# Altium schematic sheet 09_test8.SchDoc
size A3
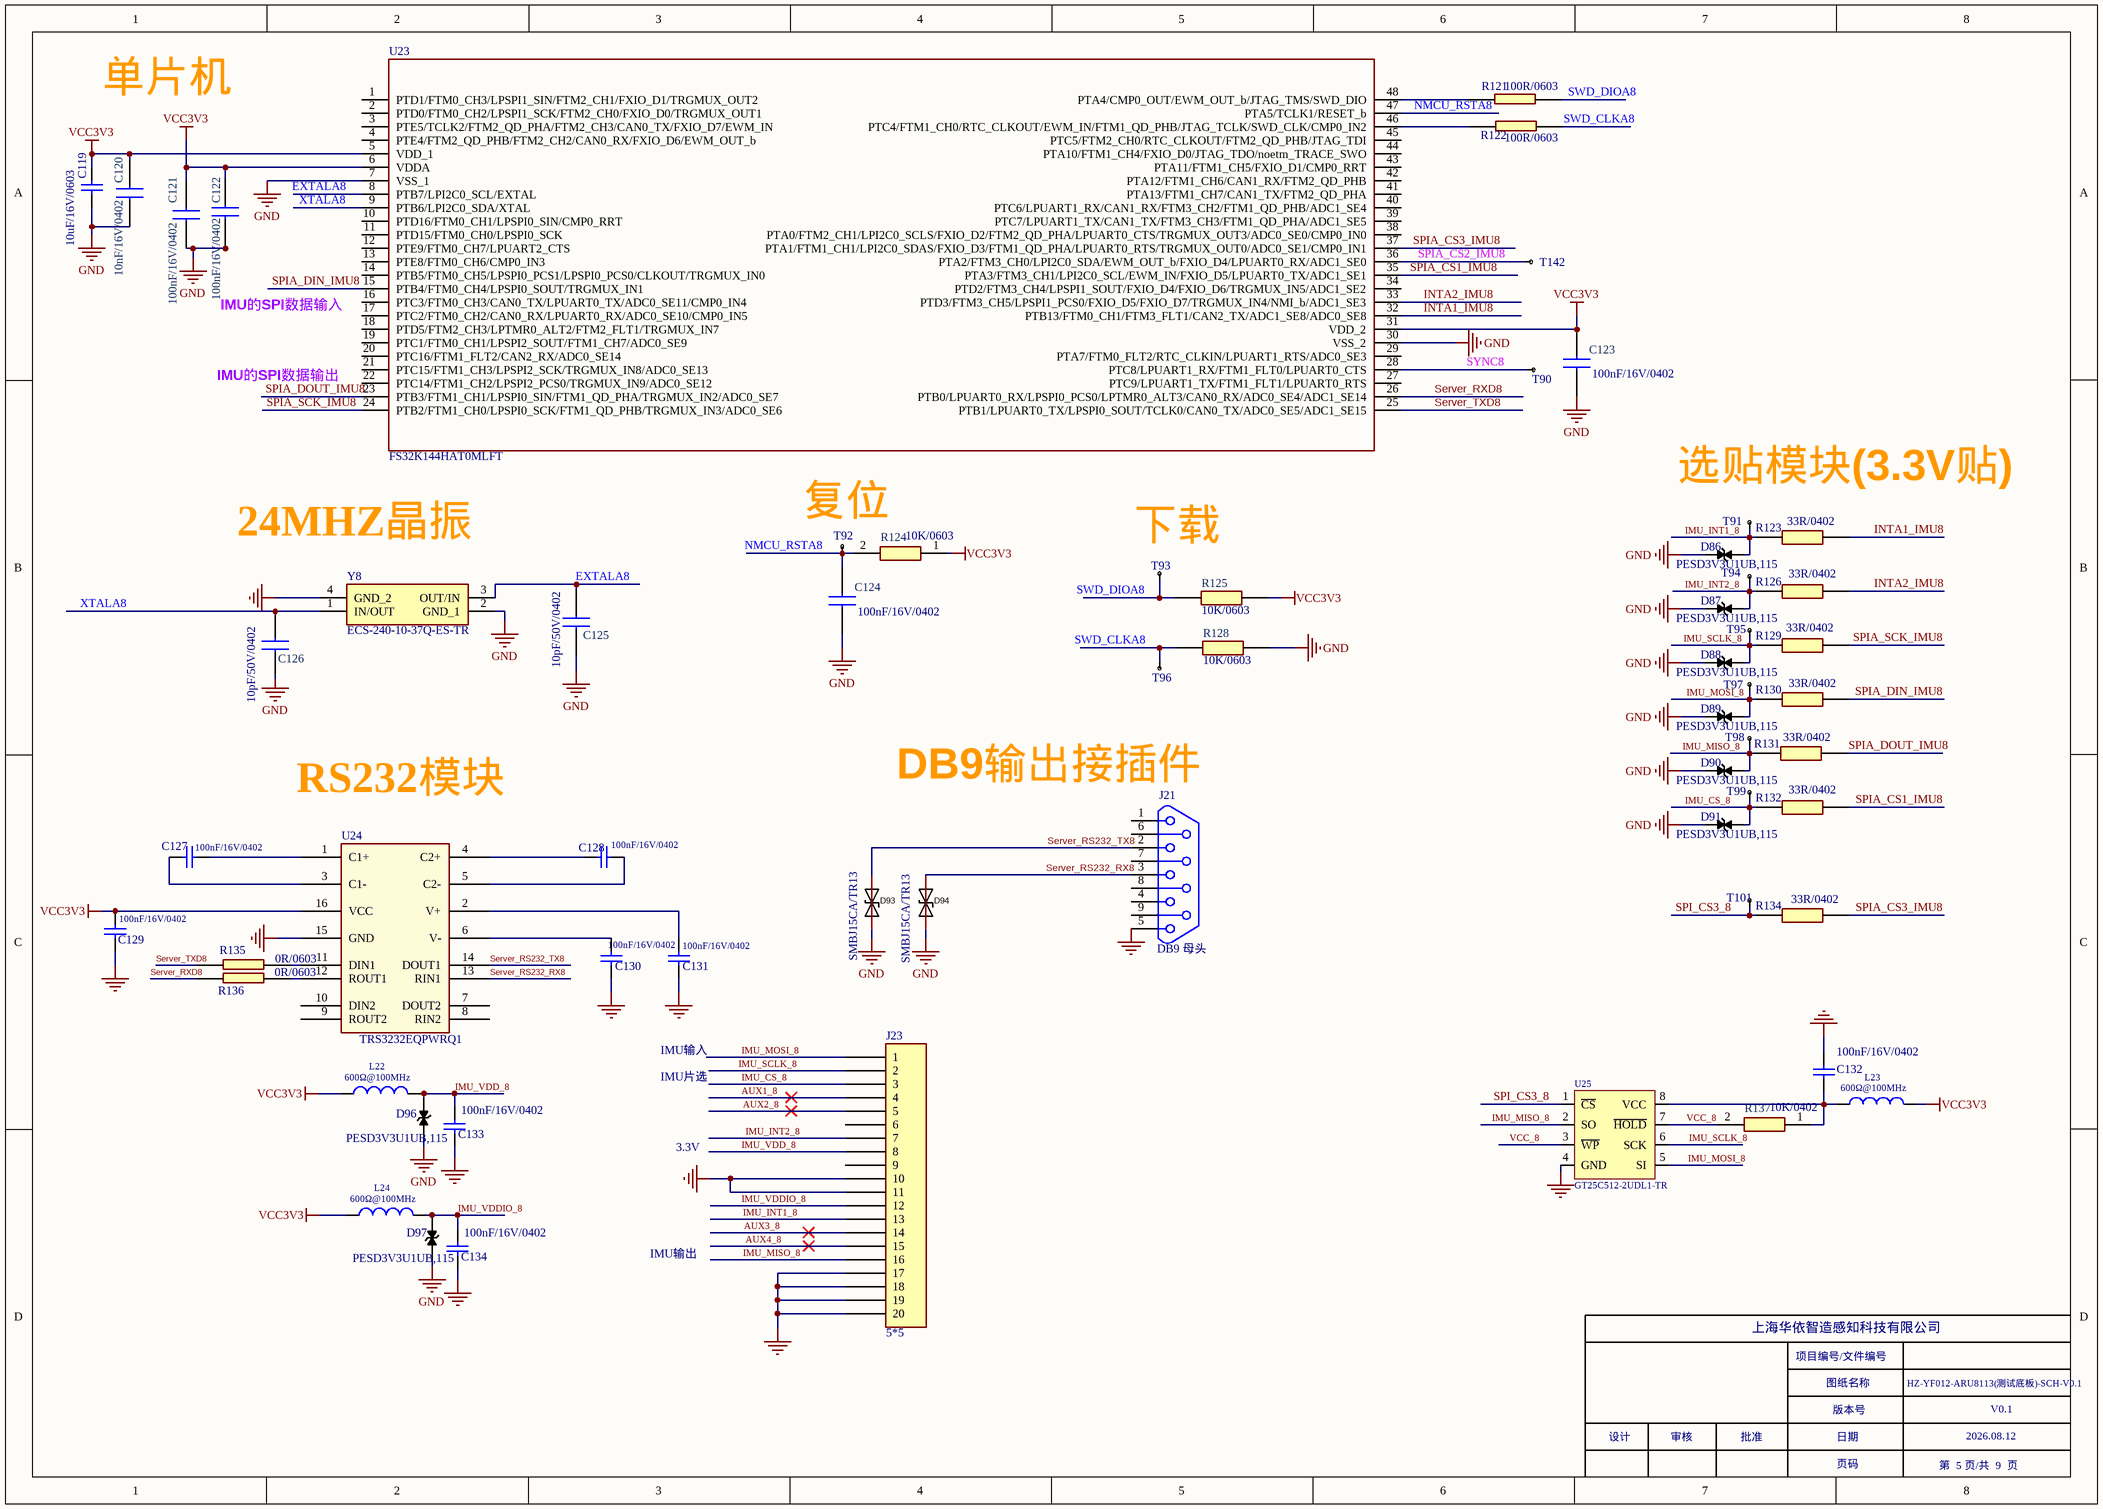
[diagram p0: 09_test8.SchDoc]

## Parts
C119  10uF/16V/0603  [C 0603_L]
C120  10nF/16V/0402  [C 0402_L]
C121  100nF/16V/0402  [C 0402_L]
C122  100nF/16V/0402  [C 0402_L]
C123  100nF/16V/0402  [C 0402_L]
C124  100nF/16V/0402  [C 0402_L]
C125  10pF/50V/0402  [C 0402_L]
C126  10pF/50V/0402  [C 0402_L]
C127  value 100nF/16V/0402  [C 0402_L]  (hidden comment: Cap)
C128  value 100nF/16V/0402  [C 0402_L]  (hidden comment: Cap)
C129  value 100nF/16V/0402  [C 0402_L]  (hidden comment: Cap)
C130  value 100nF/16V/0402  [C 0402_L]  (hidden comment: Cap)
C131  value 100nF/16V/0402  [C 0402_L]  (hidden comment: Cap)
C132  100nF/16V/0402  [0402C]
C133  100nF/16V/0402  [0402C]
C134  100nF/16V/0402  [0402C]
D86  PESD3V3U1UB,115  [SOD-523]
D87  PESD3V3U1UB,115  [SOD-523]
D88  PESD3V3U1UB,115  [SOD-523]
D89  PESD3V3U1UB,115  [SOD-523]
D90  PESD3V3U1UB,115  [SOD-523]
D91  PESD3V3U1UB,115  [SOD-523]
D93  SMBJ15CA/TR13  [SMB]
D94  SMBJ15CA/TR13  [SMB]
D96  PESD3V3U1UB,115  [PESD3V3U1UB,115]
D97  PESD3V3U1UB,115  [PESD3V3U1UB,115]
J21  DB9 母头  [DB9-RS8R1-2R77]
J23  5*5  [5*5-socket]
L22  value 600Ω@100MHz  [0603L]  (hidden comment: Inductor)
L23  value 600Ω@100MHz  [0603L]  (hidden comment: Inductor)
L24  value 600Ω@100MHz  [0603L]  (hidden comment: Inductor)
R121  100R/0603  [R 0603_L]
R122  100R/0603  [R 0603_L]
R123  33R/0402  [0402R]
R124  10K/0603  [R 0603_L]
R125  10K/0603  [R 0603_L]
R126  33R/0402  [0402R]
R128  10K/0603  [R 0603_L]
R129  33R/0402  [0402R]
R130  33R/0402  [0402R]
R131  33R/0402  [0402R]
R132  33R/0402  [0402R]
R134  33R/0402  [0402R]
R135  0R/0603  [R 0603_L]
R136  0R/0603  [R 0603_L]
R137  10K/0402  [0402R]
T90  TEST  [Test-0.5mm]  (value not drawn)
T91  TEST  [TEST]  (value not drawn)
T92  TEST  [TEST]  (value not drawn)
T93  TEST  [TEST]  (value not drawn)
T94  TEST  [TEST]  (value not drawn)
T95  TEST  [TEST]  (value not drawn)
T96  TEST  [TEST]  (value not drawn)
T97  TEST  [TEST]  (value not drawn)
T98  TEST  [TEST]  (value not drawn)
T99  TEST  [TEST]  (value not drawn)
T101  TEST  [TEST]  (value not drawn)
T142  TEST  [Test-0.5mm]  (value not drawn)
U23  FS32K144HAT0MLFT  [LQFP48_7X7]
U24  TRS3232EQPWRQ1  [TSSOP16_640X500]
U25  GT25C512-2UDL1-TR  [GT25C512-2UDLA2-TR]
Y8  ECS-240-10-37Q-ES-TR  [ECS2401037QESTR]

## Nets
GND: C119.2 C120.1 C121.2 C122.2 C123.2 C124.2 C125.1 C126.1 C129.2 C130.2 C131.2 C132.1 C133.2 C134.2 D86.1 D87.1 D88.1 D89.1 D90.1 D91.1 D93.1 D94.1 D96.1 D97.1 J21.5 J23.10 J23.11 J23.17 J23.18 J23.19 J23.20 R128.1 U23.7(VSS_1) U23.30(VSS_2) U24.15(GND) U25.4(GND) Y8.2(GND_1) Y8.4(GND_2)
VCC3V3: C119.1 C120.2 C121.1 C122.1 C123.1 C129.1 L22.1 L23.2 L24.1 R124.1 R125.1 U23.5(VDD_1) U23.6(VDDA) U23.31(VDD_2) U24.16(VCC)
AUX1_8: J23.4
AUX2_8: J23.5
AUX3_8: J23.14
AUX4_8: J23.15
EXTALA8: C125.2 U23.8(PTB7/LPI2C0_SCL/EXTAL) Y8.3(OUT/IN)
IMU_CS_8: D91.2 J23.3 R132.2 T99.1
IMU_INT1_8: D86.2 J23.13 R123.2 T91.1
IMU_INT2_8: D87.2 J23.7 R126.2 T94.1
IMU_MISO_8: D90.2 J23.16 R131.2 T98.1 U25.2(SO)
IMU_MOSI_8: D89.2 J23.1 R130.2 T97.1 U25.5(SI)
IMU_SCLK_8: D88.2 J23.2 R129.2 T95.1 U25.6(SCK)
IMU_VDD_8: C133.1 D96.2 J23.8 L22.2
IMU_VDDIO_8: C134.1 D97.2 J23.12 L24.2
INTA1_IMU8: R123.1 U23.32(PTB13/FTM0_CH1/FTM3_FLT1/CAN2_TX/ADC1_SE8/ADC0_SE8)
INTA2_IMU8: R126.1 U23.33(PTD3/FTM3_CH5/LPSPI1_PCS0/FXIO_D5/FXIO_D7/TRGMUX_IN4/NMI_b/ADC1_SE3)
NMCU_RSTA8: C124.1 R124.2 T92.1 U23.47(PTA5/TCLK1/RESET_b)
Server_RS232_RX8: D94.2 J21.3 U24.13(RIN1)
Server_RS232_TX8: D93.2 J21.2 U24.14(DOUT1)
Server_RXD8: R136.1 U23.26(PTB0/LPUART0_RX/LPSPI0_PCS0/LPTMR0_ALT3/CAN0_RX/ADC0_SE4/ADC1_SE14)
Server_TXD8: R135.1 U23.25(PTB1/LPUART0_TX/LPSPI0_SOUT/TCLK0/CAN0_TX/ADC0_SE5/ADC1_SE15)
SPI_CS3_8: R134.2 T101.1 U25.1(~{CS})
SPIA_CS1_IMU8: R132.1 U23.35(PTA3/FTM3_CH1/LPI2C0_SCL/EWM_IN/FXIO_D5/LPUART0_TX/ADC1_SE1)
SPIA_CS2_IMU8: T142.1 U23.36(PTA2/FTM3_CH0/LPI2C0_SDA/EWM_OUT_b/FXIO_D4/LPUART0_RX/ADC1_SE0)
SPIA_CS3_IMU8: R134.1 U23.37(PTA1/FTM1_CH1/LPI2C0_SDAS/FXIO_D3/FTM1_QD_PHA/LPUART0_RTS/TRGMUX_OUT0/ADC0_SE1/CMP0_IN1)
SPIA_DIN_IMU8: R130.1 U23.15(PTB4/FTM0_CH4/LPSPI0_SOUT/TRGMUX_IN1)
SPIA_DOUT_IMU8: R131.1 U23.23(PTB3/FTM1_CH1/LPSPI0_SIN/FTM1_QD_PHA/TRGMUX_IN2/ADC0_SE7)
SPIA_SCK_IMU8: R129.1 U23.24(PTB2/FTM1_CH0/LPSPI0_SCK/FTM1_QD_PHB/TRGMUX_IN3/ADC0_SE6)
SWD_CLKA8: R122.2 R128.2 T96.1
SWD_DIOA8: R121.2 R125.2 T93.1
SYNC8: T90.1 U23.28(PTC8/LPUART1_RX/FTM1_FLT0/LPUART0_CTS)
VCC_8: R137.2 U25.3(~{WP}) U25.7(~{HOLD})
XTALA8: C126.2 U23.9(PTB6/LPI2C0_SDA/XTAL) Y8.1(IN/OUT)
NetC127_1: C127.1 U24.3(C1-)
NetC127_2: C127.2 U24.1(C1+)
NetC128_1: C128.1 U24.4(C2+)
NetC128_2: C128.2 U24.5(C2-)
NetC130_1: C130.1 U24.6(V-)
NetC131_1: C131.1 U24.2(V+)
NetC132_2: C132.2 L23.1 R137.1 U25.8(VCC)
NetR121_1: R121.1 U23.48(PTA4/CMP0_OUT/EWM_OUT_b/JTAG_TMS/SWD_DIO)
NetR122_1: R122.1 U23.46(PTC4/FTM1_CH0/RTC_CLKOUT/EWM_IN/FTM1_QD_PHB/JTAG_TCLK/SWD_CLK/CMP0_IN2)
NetR135_2: R135.2 U24.11(DIN1)
NetR136_2: R136.2 U24.12(ROUT1)

Not connected (* = marked no-connect by the designer): J21 1 4 6 7 8 9; J23 6 9; U23 1(PTD1/FTM0_CH3/LPSPI1_SIN/FTM2_CH1/FXIO_D1/TRGMUX_OUT2) 2(PTD0/FTM0_CH2/LPSPI1_SCK/FTM2_CH0/FXIO_D0/TRGMUX_OUT1) 3(PTE5/TCLK2/FTM2_QD_PHA/FTM2_CH3/CAN0_TX/FXIO_D7/EWM_IN) 4(PTE4/FTM2_QD_PHB/FTM2_CH2/CAN0_RX/FXIO_D6/EWM_OUT_b) 10(PTD16/FTM0_CH1/LPSPI0_SIN/CMP0_RRT) 11(PTD15/FTM0_CH0/LPSPI0_SCK) 12(PTE9/FTM0_CH7/LPUART2_CTS) 13(PTE8/FTM0_CH6/CMP0_IN3) 14(PTB5/FTM0_CH5/LPSPI0_PCS1/LPSPI0_PCS0/CLKOUT/TRGMUX_IN0) 16(PTC3/FTM0_CH3/CAN0_TX/LPUART0_TX/ADC0_SE11/CMP0_IN4) 17(PTC2/FTM0_CH2/CAN0_RX/LPUART0_RX/ADC0_SE10/CMP0_IN5) 18(PTD5/FTM2_CH3/LPTMR0_ALT2/FTM2_FLT1/TRGMUX_IN7) 19(PTC1/FTM0_CH1/LPSPI2_SOUT/FTM1_CH7/ADC0_SE9) 20(PTC16/FTM1_FLT2/CAN2_RX/ADC0_SE14) 21(PTC15/FTM1_CH3/LPSPI2_SCK/TRGMUX_IN8/ADC0_SE13) 22(PTC14/FTM1_CH2/LPSPI2_PCS0/TRGMUX_IN9/ADC0_SE12) 27(PTC9/LPUART1_TX/FTM1_FLT1/LPUART0_RTS) 29(PTA7/FTM0_FLT2/RTC_CLKIN/LPUART1_RTS/ADC0_SE3) 34(PTD2/FTM3_CH4/LPSPI1_SOUT/FXIO_D4/FXIO_D6/TRGMUX_IN5/ADC1_SE2) 38(PTA0/FTM2_CH1/LPI2C0_SCLS/FXIO_D2/FTM2_QD_PHA/LPUART0_CTS/TRGMUX_OUT3/ADC0_SE0/CMP0_IN0) 39(PTC7/LPUART1_TX/CAN1_TX/FTM3_CH3/FTM1_QD_PHA/ADC1_SE5) 40(PTC6/LPUART1_RX/CAN1_RX/FTM3_CH2/FTM1_QD_PHB/ADC1_SE4) 41(PTA13/FTM1_CH7/CAN1_TX/FTM2_QD_PHA) 42(PTA12/FTM1_CH6/CAN1_RX/FTM2_QD_PHB) 43(PTA11/FTM1_CH5/FXIO_D1/CMP0_RRT) 44(PTA10/FTM1_CH4/FXIO_D0/JTAG_TDO/noetm_TRACE_SWO) 45(PTC5/FTM2_CH0/RTC_CLKOUT/FTM2_QD_PHB/JTAG_TDI); U24 7(DOUT2) 8(RIN2) 9(ROUT2) 10(DIN2)

## Notes on the sheet
- 单片机
- IMU的SPI数据输入
- IMU的SPI数据输出
- 选贴模块(3.3V贴)
- (near Y8) 24MHZ晶振
- (near T92) 复位
- (near T93) 下载
- DB9输出接插件
- (near U24) RS232模块
- IMU输入
- IMU片选
- 3.3V
- IMU输出
- 上海华依智造感知科技有限公司
- 项目编号/文件编号
- 图纸名称
- HZ-YF012-ARU8113(测试底板)-SCH-V0.1
- 设计
- 审核
- 批准
- 版本号
- 日期
- 2026.08.12
- V0.1
- 页码
- 第  5 页/共  9  页

## Library data of the parts
C119 = Cap: SMD/SMT 10UF 16V 20% 0603; Published: 8-Jun-2000; LatestRevisionDate: 17-Jul-2002; LatestRevisionNote: Re-released for DXP Platform.; PackageReference: RAD-0.3; Publisher: Altium Limited; PackageDescription: Radial Cap, Thru-Hole; 2 Leads; 0.3 in Pin Spacing; Value: 10uF/16V
C120-C126 = 0402Capacitor: Capacitor; Manufacturer_Name: Murata Electronics; Manufacturer_Part_Number: GCM155R71C104KA55D; Datasheet Link: https://componentsearchengine.com//GCM155R71C104KA55D.pdf; Height: 0.55mm; Mouser2 Part Number: 81-GCM155R71C104KA5D; Mouser2 Price/Stock: https://www.mouser.com/Search/Refine.aspx?Keyword=81-GCM155R71C104KA5D
C127-C134 = Cap: '100nF/16V/10%/ 0402/X7R / -55℃ ～ 125℃/AEC-Q200; Published: 8-Jun-2000; LatestRevisionDate: 17-Jul-2002; LatestRevisionNote: Re-released for DXP Platform.; PackageReference: RAD-0.3; Publisher: Altium Limited; PackageDescription: Radial Cap, Thru-Hole; 2 Leads; 0.3 in Pin Spacing
  C132-C134: Value: 100nF/16V/0402
D86-D91 D96 D97 = SMBJ36CA: 双向TVS管；600W表面贴装瞬态电压抑制器,工作电压36V，SMB_DO-214AA封装 DIODES
D93 D94 = SMBJ15CA/TR13_C78410: Manufacturer: Brightking(君耀电子); Symbol: SMBJ15CA-C78410; Add into BOM: yes; polarity: 双向; Reverse Stand-Off Voltage (Vrwm): 15V; Maximum Clamping Voltage: 24.4V; Peak Pulse Current (Ipp)@10/1000us: 24.6A; Peak Pulse Power Dissipation (Ppp)@10/1000us: 600W; Breakdown Voltage: 16.7V; Type: TVS; Device: SMBJ15CA/TR13_C78410; LCSC Part Name: 双向 15V截止 24.6A峰值脉冲; Supplier Part: C78410; Manufacturer Part: SMBJ15CA/TR13; Supplier Footprint: SMB(DO-214AA); JLCPCB Part Class: Extended Part; Datasheet: https://atta.szlcsc.com/upload/public/pdf/source/20181127/C309995_EB3DFB9F9AEE5D2146ECD9FA5992A402.pdf; Supplier: LCSC; Convert to PCB: yes
J21 = DB9
L22-L24 = Inductor: Code_IEC: 1005; Published: 8-Jun-2000; LatestRevisionDate: 29-May-2009; LatestRevisionNote: IPC-7351 Footprint Added.; PackageReference: 0402-A; Publisher: Altium Limited; PackageDescription: Chip Inductor; Code_JEITA: 0402
R121 R122 R135 R136 = 0402
R123-R126 R128-R132 R134 R137 = 0402Resistor: Resistor; Manufacturer_Name: KOA Speer; Manufacturer_Part_Number: RN73H1ETTP1002F50; Datasheet Link: https://www.mouser.fr/datasheet/2/219/RN73H-12200.pdf; Height: 0.4mm
U23 = FS32K144HAT0MLFT: Integrated Circuit; Manufacturer_Name: NXP; Datasheet Link: http://www.nxp.com/docs/en/data-sheet/S32K-DS.pdf; Height: 1.6mm; Manufacturer_Part_Number: FS32K144HAT0MLFT
U25 = GT25C512-2UDLA2-TR
Y8 = ECS-240-10-37Q-ES-TR: Crystal or Oscillator; Manufacturer_Name: ECS; Datasheet Link: https://www.ecsxtal.com/store/pdf/ECX-1637Q.pdf; Height: 0.55mm; Manufacturer_Part_Number: ECS-240-10-37Q-ES-TR